# Altium schematic sheet Sensor_Sheet.SchDoc
size A4; DocumentNumber: 3; SheetNumber: 3; SheetTotal: 11
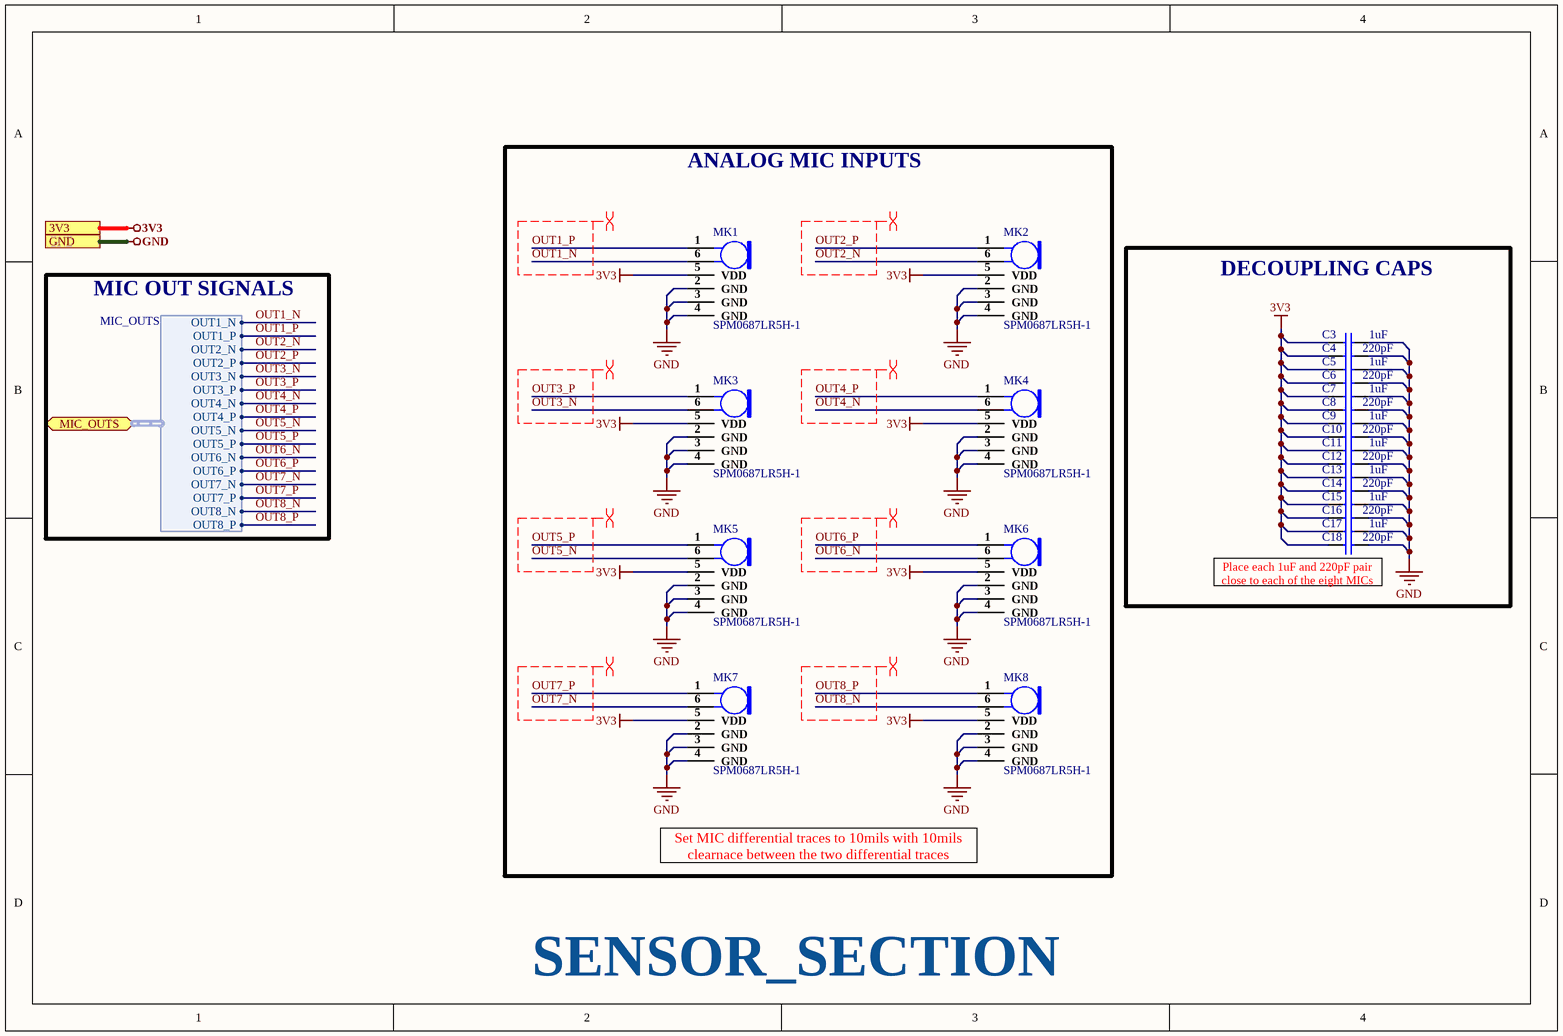
[diagram p0: Sensor_Sheet.SchDoc]

## Parts
C3  1uF  [Cap-0402]
C4  220pF  [Cap 0402]
C5  1uF  [Cap-0402]
C6  220pF  [Cap 0402]
C7  1uF  [Cap-0402]
C8  220pF  [Cap 0402]
C9  1uF  [Cap-0402]
C10  220pF  [Cap 0402]
C11  1uF  [Cap-0402]
C12  220pF  [Cap 0402]
C13  1uF  [Cap-0402]
C14  220pF  [Cap 0402]
C15  1uF  [Cap-0402]
C16  220pF  [Cap 0402]
C17  1uF  [Cap-0402]
C18  220pF  [Cap 0402]
MK1  SPM0687LR5H-1  [SPM0687LR5H-1]
MK2  SPM0687LR5H-1  [SPM0687LR5H-1]
MK3  SPM0687LR5H-1  [SPM0687LR5H-1]
MK4  SPM0687LR5H-1  [SPM0687LR5H-1]
MK5  SPM0687LR5H-1  [SPM0687LR5H-1]
MK6  SPM0687LR5H-1  [SPM0687LR5H-1]
MK7  SPM0687LR5H-1  [SPM0687LR5H-1]
MK8  SPM0687LR5H-1  [SPM0687LR5H-1]

## Blocks framed on the sheet
ANALOG MIC INPUTS: MK1-MK8
DECOUPLING CAPS: C3-C18

## Ports
3V3, GND, MIC_OUTS (bidir, harness MIC_OUTS)

## Harnesses
MIC_OUTS: OUT1_N, OUT1_P, OUT2_N, OUT2_P, OUT3_N, OUT3_P, OUT4_N, OUT4_P, OUT5_N, OUT5_P, OUT6_N, OUT6_P, OUT7_N, OUT7_P, OUT8_N, OUT8_P

## Nets
3V3: C3.1 C4.1 C5.1 C6.1 C7.1 C8.1 C9.1 C10.1 C11.1 C12.1 C13.1 C14.1 C15.1 C16.1 C17.1 C18.1 MK1.5(VDD) MK2.5(VDD) MK3.5(VDD) MK4.5(VDD) MK5.5(VDD) MK6.5(VDD) MK7.5(VDD) MK8.5(VDD) ; port 3V3
GND: C3.2 C4.2 C5.2 C6.2 C7.2 C8.2 C9.2 C10.2 C11.2 C12.2 C13.2 C14.2 C15.2 C16.2 C17.2 C18.2 MK1.2(GND) MK1.3(GND) MK1.4(GND) MK2.2(GND) MK2.3(GND) MK2.4(GND) MK3.2(GND) MK3.3(GND) MK3.4(GND) MK4.2(GND) MK4.3(GND) MK4.4(GND) MK5.2(GND) MK5.3(GND) MK5.4(GND) MK6.2(GND) MK6.3(GND) MK6.4(GND) MK7.2(GND) MK7.3(GND) MK7.4(GND) MK8.2(GND) MK8.3(GND) MK8.4(GND) ; port GND
OUT1_N: MK1.6(OUT-) ; port MIC_OUTS.OUT1_N
OUT1_P: MK1.1(OUT+) ; port MIC_OUTS.OUT1_P
OUT2_N: MK2.6(OUT-) ; port MIC_OUTS.OUT2_N
OUT2_P: MK2.1(OUT+) ; port MIC_OUTS.OUT2_P
OUT3_N: MK3.6(OUT-) ; port MIC_OUTS.OUT3_N
OUT3_P: MK3.1(OUT+) ; port MIC_OUTS.OUT3_P
OUT4_N: MK4.6(OUT-) ; port MIC_OUTS.OUT4_N
OUT4_P: MK4.1(OUT+) ; port MIC_OUTS.OUT4_P
OUT5_N: MK5.6(OUT-) ; port MIC_OUTS.OUT5_N
OUT5_P: MK5.1(OUT+) ; port MIC_OUTS.OUT5_P
OUT6_N: MK6.6(OUT-) ; port MIC_OUTS.OUT6_N
OUT6_P: MK6.1(OUT+) ; port MIC_OUTS.OUT6_P
OUT7_N: MK7.6(OUT-) ; port MIC_OUTS.OUT7_N
OUT7_P: MK7.1(OUT+) ; port MIC_OUTS.OUT7_P
OUT8_N: MK8.6(OUT-) ; port MIC_OUTS.OUT8_N
OUT8_P: MK8.1(OUT+) ; port MIC_OUTS.OUT8_P

## Layout directives
differential pair; net class OUT1; differential pair class OUT1_Lines; rule Matched Net Lengths [Tolerance = 20mil]; rule Impedance Constraint [Min = 85.00    Max = 95.00    ]: OUT1_N, OUT1_P
differential pair; net class OUT3; differential pair class OUT3_Lines; rule Matched Net Lengths [Tolerance = 20mil]; rule Impedance Constraint [Min = 85.00    Max = 95.00    ]: OUT3_N, OUT3_P
differential pair; net class OUT5; differential pair class OUT5_Lines; rule Matched Net Lengths [Tolerance = 20mil]; rule Impedance Constraint [Min = 85.00    Max = 95.00    ]: OUT5_N, OUT5_P
differential pair; net class OUT7; differential pair class OUT7_Lines; rule Matched Net Lengths [Tolerance = 20mil]; rule Impedance Constraint [Min = 85.00    Max = 95.00    ]: OUT7_N, OUT7_P
differential pair; net class OUT8; differential pair class OUT8_Lines; rule Matched Net Lengths [Tolerance = 20mil]; rule Impedance Constraint [Min = 85.00    Max = 95.00    ]: OUT8_N, OUT8_P
differential pair; net class OUT6; differential pair class OUT6_Lines; rule Matched Net Lengths [Tolerance = 20mil]; rule Impedance Constraint [Min = 85.00    Max = 95.00    ]: OUT6_N, OUT6_P
differential pair; net class OUT4; differential pair class OUT4_Lines; rule Matched Net Lengths [Tolerance = 20mil]; rule Impedance Constraint [Min = 85.00    Max = 95.00    ]: OUT4_N, OUT4_P
differential pair; net class OUT2; differential pair class OUT2_Lines; rule Matched Net Lengths [Tolerance = 20mil]; rule Impedance Constraint [Min = 85.00    Max = 95.00    ]: OUT2_N, OUT2_P

## Notes on the sheet
- MIC OUT SIGNALS
- (near C18) Place each 1uF and 220pF pair close to each of the eight MICs
- Set MIC differential traces to 10mils with 10mils clearnace between the two differential traces
- SENSOR_SECTION
- File:
- Title:
- Date:
- Page
- Num:
- Total:
- Drawn By: Huzaifa Ali

## Library data of the parts
C3 C5 C7 C9 C11 C13 C15 C17 = CC0402KRX5R8BB105: CAP CER 1UF 25V X5R 0402; Manufacturer: Yageo; Tolerance: 10%; Supplier 1: Mouser; Manufacturer Part Number: CC0402KRX5R8BB105; RoHS: Yes; Category: Ceramic Capacitors; Stock 1: 91975; Pricing 1: 1=0.30000, 10=0.20400, 50=0.20400, 100=0.11600, 1000=0.07200, 10000=0.05900 (USD); Mount: Surface Mount; Case/Package: 0402; Case Code (Metric): 1005; Case Code (Imperial): 0402; Weight: 2.3E-05oz; Min Operating Temperature: -55°C; Max Operating Temperature: 85°C; Packaging: Tape and Reel; Capacitance: 1uF; Voltage Rating: 25V; Dielectric: X5R; Termination: SMD/SMT; Voltage Rating (DC): 25V; Package Quantity: 10000; Length: 0.039inch; Width: 0.02inch; Thickness: 0.022inch; Lead Free: Lead Free; Halogen Free: Halogen Free; RoHS Compliant: Yes; ComponentLink1URL: http://www.mouser.com/ds/2/447/Yageo_UPY-GP_NP0_16V-to-50V_9-358835.pdf?src-supplier=Mouser; ComponentLink1Description: http://www.mouser.com/ds/2/447/Yageo_UPY-GP_NP0_16V-to-50V_9-358835.pdf?src-supplier=Mouser; ComponentLink2URL: http://www.yageo.com/documents/recent/UPY-GPHC_X5R_4V-to-50V_25.pdf?src-supplier=Digi-Key; ComponentLink2Description: http://www.yageo.com/documents/recent/UPY-GPHC_X5R_4V-to-50V_25.pdf?src-supplier=Digi-Key; ComponentLink3URL: https://4donline.ihs.com/images/VipMasterIC/IC/YAGO/YAGO-S-A0006851646/YAGO-S-A0006851646-1.pdf?hkey=6D3A4C79FDBF58556ACFDE234799DDF0&src-supplier=Newark; ComponentLink3Description: https://4donline.ihs.com/images/VipMasterIC/IC/YAGO/YAGO-S-A0006851646/YAGO-S-A0006851646-1.pdf?hkey=6D3A4C79FDBF58556ACFDE234799DDF0&src-supplier=Newark; Supplier Part Number 1: 603-CC402KRX5R8BB105; LCSC Part Number: C326568
C4 C6 C8 C10 C12 C14 C16 C18 = CC0402JRNPO9BN221: CAP CER 220PF 50V C0G/NPO 0402; Manufacturer: Yageo; Dielectric Material: Ceramic; Tolerance: 10%; Dielectric: C0G; Temperature Coefficient: 30ppm/°C; Insulation Resistance: 10GR; Dissipation Factor: 0.1%; Supplier 1: RSComponents; Manufacturer Part Number: CC0402JRNPO9BN221; RoHS: Yes; Category: Ceramic Capacitors; Stock 1: 20000; Pricing 1: 10000=0.00600, 100000=0.00600 (GBP); Mount: Surface Mount; Case/Package: 0402; Number of Pins: 2; Case Code (Metric): 1005; Case Code (Imperial): 0402; Min Operating Temperature: -55°C; Max Operating Temperature: 125°C; Capacitance: 220pF; Package Quantity: 1; Voltage Rating: 50V; Packaging: Tape and Reel; Termination: SMD/SMT; Voltage: 50V; Series: CC; Length: 1mm; Width: 0.02inch; Height: 0.5mm; Thickness: 0.022inch; Depth: 0.5mm; Radiation Hardening: No; RoHS Compliant: Yes; REACH SVHC: No SVHC; Lead Free: Lead Free; ComponentLink1URL: https://datasheet.ciiva.com/11786/0900766b8079c870-11786154.pdf?src-supplier=RSComponents; ComponentLink1Description: https://datasheet.ciiva.com/11786/0900766b8079c870-11786154.pdf?src-supplier=RSComponents; ComponentLink2URL: https://datasheet.ciiva.com/7656/1132289-7656616.pdf?src-supplier=Element14; ComponentLink2Description: https://datasheet.ciiva.com/7656/1132289-7656616.pdf?src-supplier=Element14; ComponentLink3URL: https://datasheet.ciiva.com/8033/1443161-8033609.pdf?src-supplier=Element14; ComponentLink3Description: https://datasheet.ciiva.com/8033/1443161-8033609.pdf?src-supplier=Element14; ComponentLink4URL: https://datasheet.ciiva.com/8033/1443161-8033608.pdf?src-supplier=Element14; ComponentLink4Description: https://datasheet.ciiva.com/8033/1443161-8033608.pdf?src-supplier=Element14; ComponentLink5URL: https://datasheet.ciiva.com/176/mlccorderingcode-176384.pdf?src-supplier=Digi-Key; ComponentLink5Description: https://datasheet.ciiva.com/176/mlccorderingcode-176384.pdf?src-supplier=Digi-Key; ComponentLink6URL: https://datasheet.ciiva.com/176/mlccorderingcode-176383.pdf?src-supplier=Digi-Key; ComponentLink6Description: https://datasheet.ciiva.com/176/mlccorderingcode-176383.pdf?src-supplier=Digi-Key; ComponentLink7URL: https://datasheet.ciiva.com/176/mlccorderingcode-176385.pdf?src-supplier=Digi-Key; ComponentLink7Description: https://datasheet.ciiva.com/176/mlccorderingcode-176385.pdf?src-supplier=Digi-Key; ComponentLink8URL: https://datasheet.ciiva.com/17434/upy-gp-np0-16v-to-50v-8-17434343.pdf?src-supplier=Avnet+Europe; ComponentLink8Description: https://datasheet.ciiva.com/17434/upy-gp-np0-16v-to-50v-8-17434343.pdf?src-supplier=Avnet+Europe; Supplier Part Number 1: 6169284
MK1-MK8 = SPM0687LR5H-1: WINFREY MIC HI SNR/AOP BOT PORT; Manufacturer: Knowles; Shape: Rectangular; Output Type: Analog; Operating Supply Current: 285uA; Item Type: Microphone; Supplier 1: Digi-Key; Manufacturer Part Number: SPM0687LR5H-1; RoHS: Yes; Category: Microphones; Stock 1: 116440; Pricing 1: 1=2.12000, 10=1.75900, 25=1.62560, 50=1.52880, 100=1.43540, 500=1.23212, 1000=1.17611 (USD); Packaging: Cut Tape; Termination: Solder; ComponentLink1URL: https://media.digikey.com/pdf/Data%20Sheets/Knowles%20Acoustics%20PDFs/SPM0687LR5H-1.pdf?src-supplier=Digi-Key; ComponentLink1Description: https://media.digikey.com/pdf/Data%20Sheets/Knowles%20Acoustics%20PDFs/SPM0687LR5H-1.pdf?src-supplier=Digi-Key; Supplier Part Number 1: 423-SPM0687LR5H-1CT-ND; LCSC Part Number: *